# EasyEDA Pro project F1C200S-gateway.epro

# Schematic Schematic1_1
Assembly Variant: Basic; Board Name: Board1_1; Create Date: 2026-11-21; Page Name: P1; Project Name: 基于F1C200S的Linux无线调试与AI协作网关; Schematic Name: Schematic1_1; Update Date: 2026-11-21; Company: 嘉立创EDA; Page Size: A4; Version: V1.0
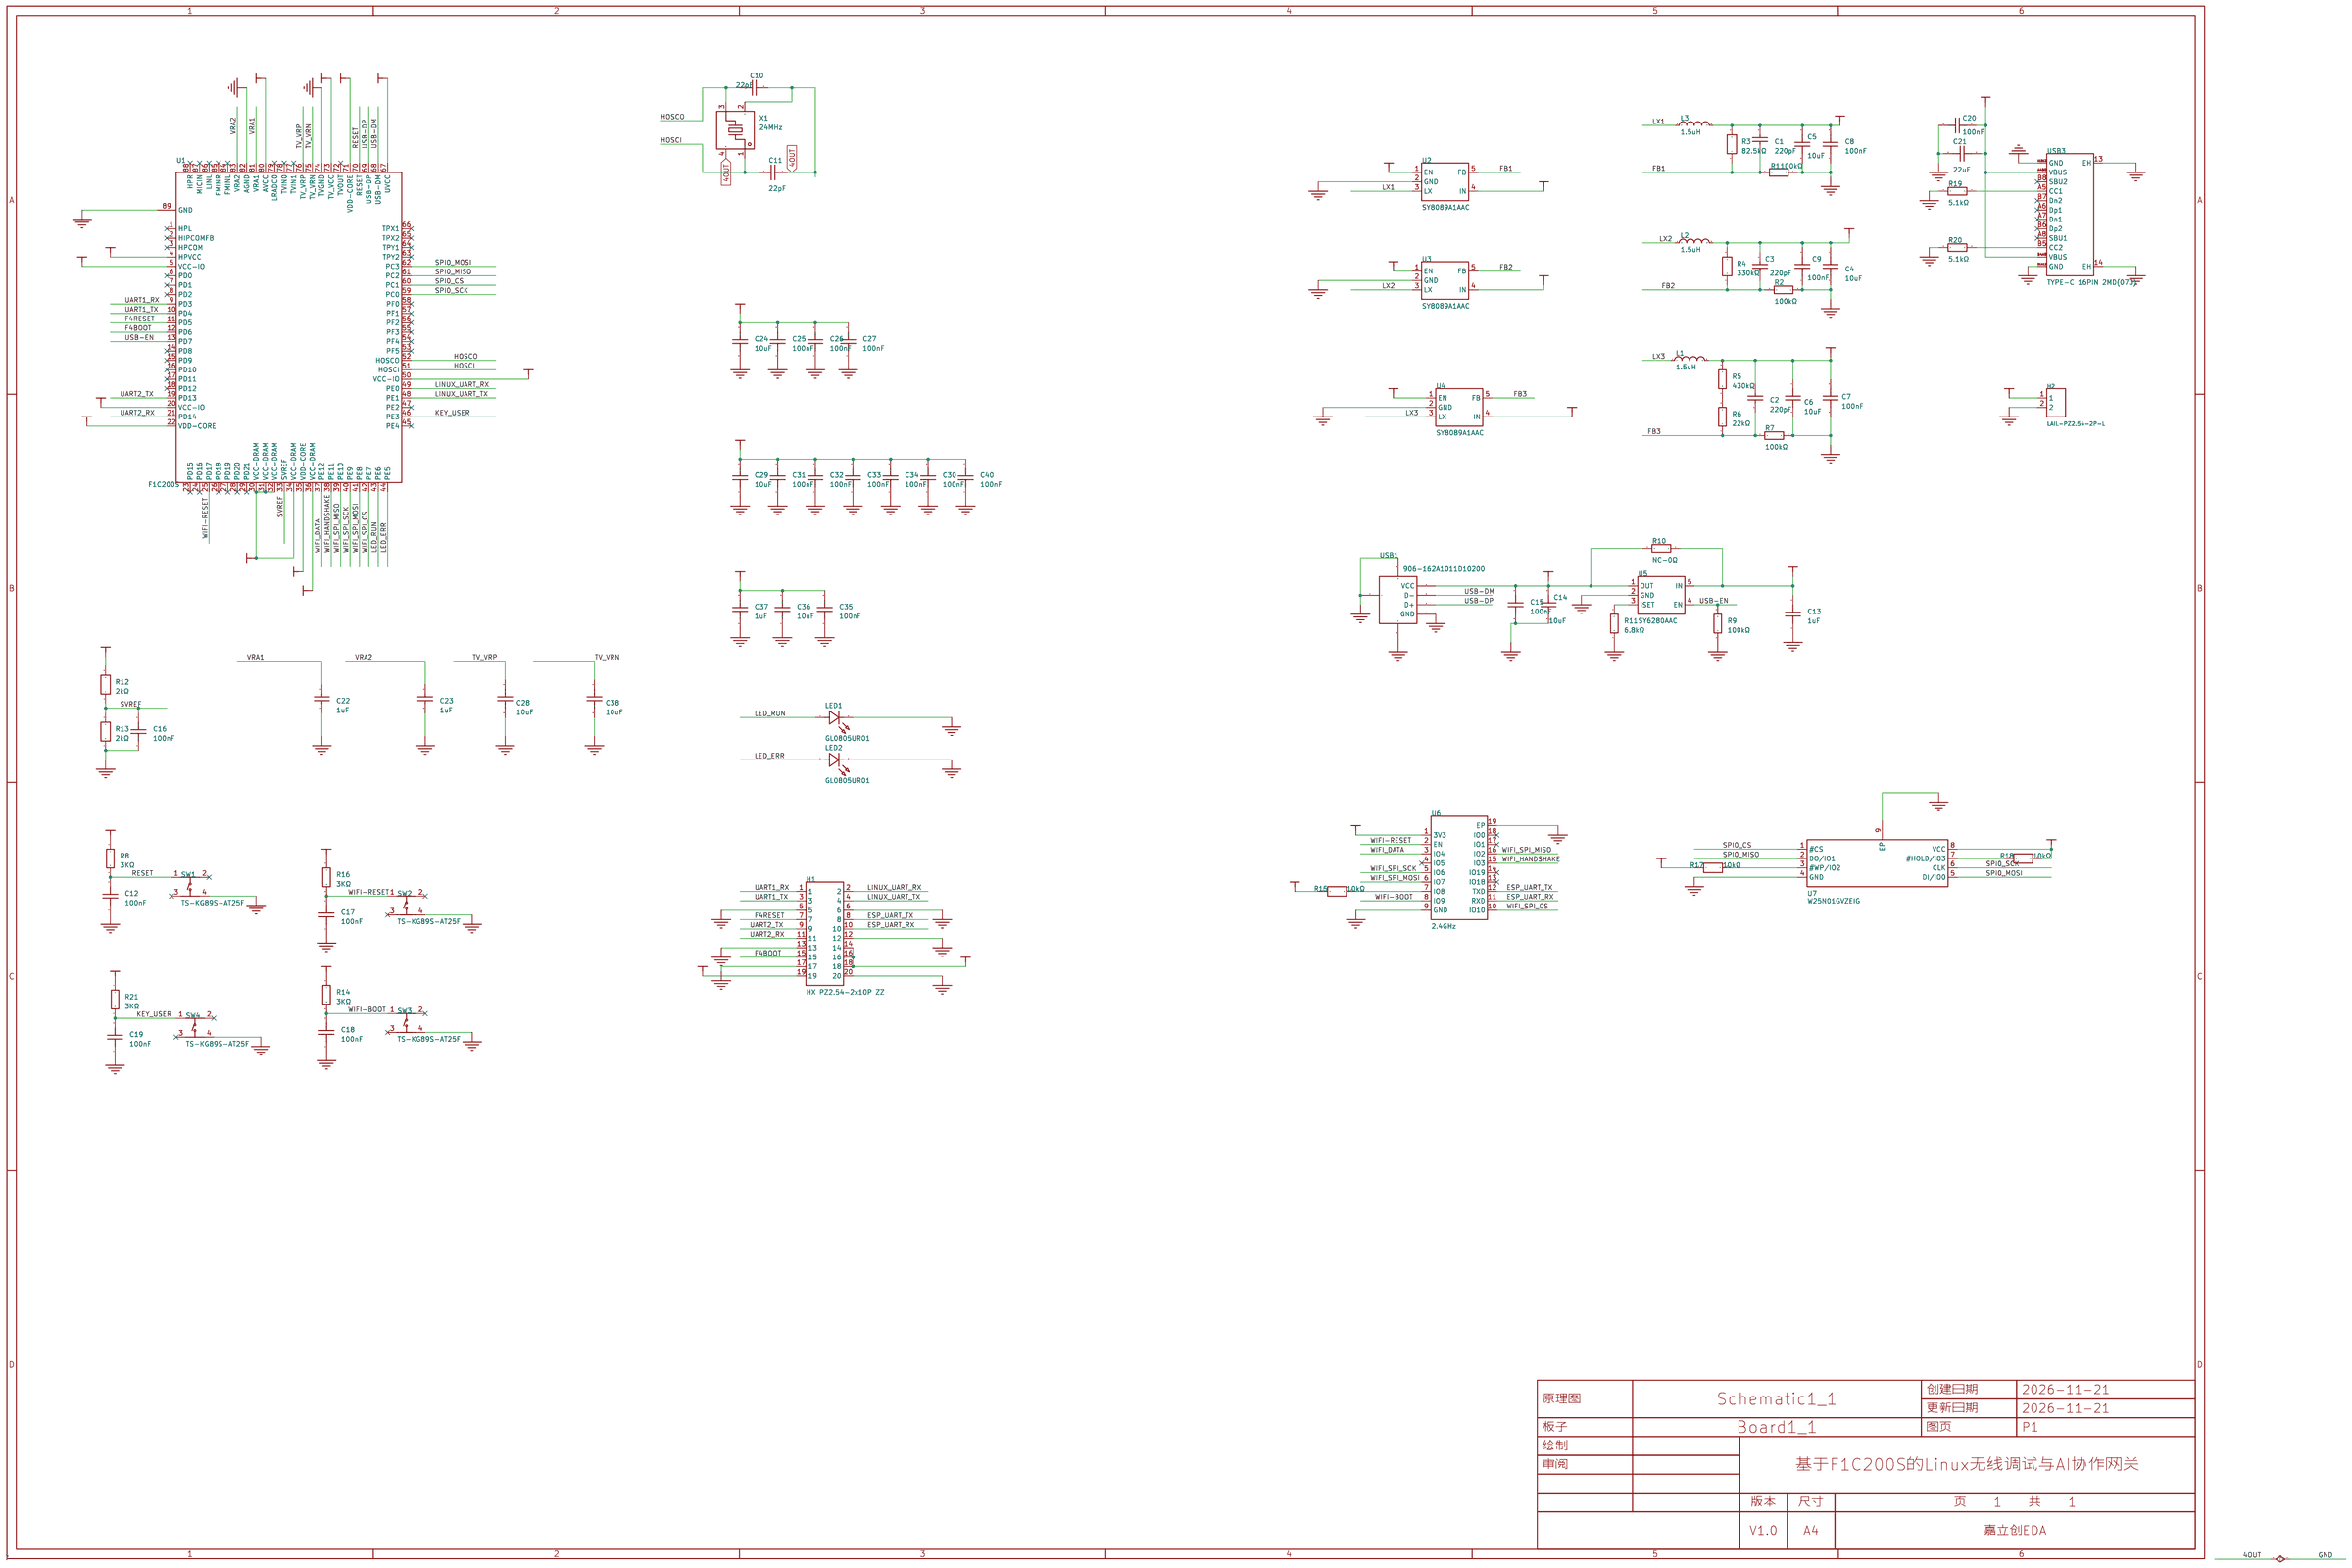
[diagram p0: schematic sheet]

## Parts
C1  220pF  [C0603]
C2  220pF  [C0603]
C3  220pF  [C0603]
C4  10uF  [C0603]
C5  10uF  [C0603]
C6  10uF  [C0603]
C7  100nF  [C0603]
C8  100nF  [C0603]
C9  100nF  [C0603]
C10  22pF  [C0603]
C11  22pF  [C0603]
C12  100nF  [C0603]
C13  1uF  [C0402]
C14  10uF  [C0603]
C15  100nF  [C0603]
C16  100nF  [C0603]
C17  100nF  [C0603]
C18  100nF  [C0603]
C19  100nF  [C0603]
C20  100nF  [C0603]
C21  22uF  [C0603]
C22  1uF  [C0603]
C23  1uF  [C0603]
C24  10uF  [C0603]
C25  100nF  [C0603]
C26  100nF  [C0603]
C27  100nF  [C0603]
C28  10uF  [C0603]
C29  10uF  [C0603]
C30  100nF  [C0603]
C31  100nF  [C0603]
C32  100nF  [C0603]
C33  100nF  [C0603]
C34  100nF  [C0603]
C35  100nF  [C0603]
C36  10uF  [C0603]
C37  1uF  [C0603]
C38  10uF  [C0603]
C40  100nF  [C0603]
H1  HX PZ2.54-2x10P ZZ  [HDR-TH_20P-P2.54-V-M-R2-C10-S2.54]
H2  LAIL-PZ2.54-2P-L  [CONN-TH_LAIL-PZ2.54-2P-L]
L1  1.5uH  [L0805]
L2  1.5uH  [L0805]
L3  1.5uH  [L0805]
LED1  GL0805UR01  [LED0805-R-RD_RED]
LED2  GL0805UR01  [LED0805-R-RD_RED]
R1  100kΩ  [R0805]
R2  100kΩ  [R0805]
R3  82.5kΩ  [R0805]
R4  330kΩ  [R0805]
R5  430kΩ  [R0805]
R6  22kΩ  [R0805]
R7  100kΩ  [R0805]
R8  3KΩ  [R0805]
R9  100kΩ  [R0805]
R10  NC-0Ω  [R0805]
R11  6.8kΩ  [R0805]
R12  2kΩ  [R0805]
R13  2kΩ  [R0805]
R14  3KΩ  [R0805]
R15  10kΩ  [R0805]
R16  3KΩ  [R0805]
R17  10kΩ  [R0805]
R18  10kΩ  [R0805]
R19  5.1kΩ  [R0805]
R20  5.1kΩ  [R0805]
R21  3KΩ  [R0805]
SW1  TS-KG89S-AT25F  [SW-SMD_4P-L4.2-W3.3-P2.15-LS5.1]
SW2  TS-KG89S-AT25F  [SW-SMD_4P-L4.2-W3.3-P2.15-LS5.1]
SW3  TS-KG89S-AT25F  [SW-SMD_4P-L4.2-W3.3-P2.15-LS5.1]
SW4  TS-KG89S-AT25F  [SW-SMD_4P-L4.2-W3.3-P2.15-LS5.1]
U1  F1C200S  [QFN-88_L10.0-W10.0-P0.40-BL-EP6.75]
U2  SY8089A1AAC  [TSOT-23-5_L2.9-W1.6-P0.95-LS2.8-BR]
U3  SY8089A1AAC  [TSOT-23-5_L2.9-W1.6-P0.95-LS2.8-BR]
U4  SY8089A1AAC  [TSOT-23-5_L2.9-W1.6-P0.95-LS2.8-BR]
U5  SY6280AAC  [SOT-23-5_L3.0-W1.7-P0.95-LS2.8-BL]
U6  2.4GHz  [BULETM-SMD_ESPRESSIF_ESP32-C3-WROOM-02-N4-4MB]
U7  W25N01GVZEIG  [WSON-8_L8.0-W6.10-P1.27-TL-EP]
USB1  906-162A1011D10200  [USB-A-TH_4P-P1.40-V-F-C39416]
USB3  TYPE-C 16PIN 2MD(073)  [USB-C-SMD_TYPE-C-16PIN-2MD-073]
X1  24MHz  [CRYSTAL-SMD_4P-L3.2-W2.5-BL]

## Library data of the parts
C1-C3 = CL10B221KB8NNNC: 容值:220pF;精度:±10%;额定电压:50V;温度系数:X7R;; LCSC Part Name: 220pF ±10% 50V; Supplier Part: C1603; Manufacturer: SAMSUNG(三星); Supplier Footprint: 0603; JLCPCB Part Class: Basic Part; Datasheet: https://item.szlcsc.com/datasheet/CL10B221KB8NNNC/1955.html; Supplier: LCSC; Tolerance: ±10%; Voltage Rating: 50V; Temperature Coefficient: X7R
C4-C6 C14 C24 C28 C29 C36 C38 = CL10A106KP8NNNC: 容值:10uF;精度:±10%;额定电压:10V;温度系数:X5R;; LCSC Part Name: 10uF ±10% 10V; Supplier Part: C19702; Manufacturer: SAMSUNG(三星); Supplier Footprint: 0603; JLCPCB Part Class: Basic Part; Datasheet: https://item.szlcsc.com/datasheet/CL10A106KP8NNNC/20411.html; Supplier: LCSC; Tolerance: ±10%; Voltage Rating: 10V; Temperature Coefficient: X5R
C7-C9 C15 C20 = CGA0603X7R104K500JT: 容值:100nF;精度:±10%;额定电压:50V;温度系数:X7R;; LCSC Part Name: 100nF ±10% 50V; Supplier Part: C6119867; Manufacturer: HRE(芯声); Supplier Footprint: 0603; JLCPCB Part Class: Extended Part; Datasheet: https://item.szlcsc.com/datasheet/CGA0603X7R104K500JT/7062573.html; Supplier: LCSC; Tolerance: ±10%; Voltage Rating: 50V; Temperature Coefficient: X7R
C10 C11 = CL10C220JB8NNNC: 容值:22pF;精度:±5%;额定电压:50V;温度系数:C0G;; LCSC Part Name: 22pF ±5% 50V; Supplier Part: C1653; Manufacturer: SAMSUNG(三星); Supplier Footprint: 0603; JLCPCB Part Class: Basic Part; Datasheet: https://item.szlcsc.com/datasheet/CL10C220JB8NNNC/2005.html; Supplier: LCSC; Tolerance: ±5%; Voltage Rating: 50V; Temperature Coefficient: C0G
C12 C17-C19 C25-C27 C30-C35 C40 = CC0603KRX7R9BB104: 容值:100nF;精度:±10%;额定电压:50V;温度系数:X7R;; LCSC Part Name: 100nF ±10% 50V; Supplier Part: C14663; Manufacturer: YAGEO(国巨); Supplier Footprint: 0603; JLCPCB Part Class: Basic Part; Datasheet: https://item.szlcsc.com/datasheet/CC0603KRX7R9BB104/15331.html; Supplier: LCSC; Tolerance: ±10%; Voltage Rating: 50V; Temperature Coefficient: X7R
C13 = HGC0402R5105K500NTEJ: 容值:1uF;精度:±10%;额定电压:50V;温度系数:X5R;; LCSC Part Name: 1uF ±10% 50V; Supplier Part: C7472948; Manufacturer: Chinocera(华瓷); Supplier Footprint: 0402; JLCPCB Part Class: Extended Part; Datasheet: https://item.szlcsc.com/datasheet/HGC0402R5105K500NTEJ/8532795.html; Supplier: LCSC; Tolerance: ±10%; Voltage Rating: 50V; Temperature Coefficient: X5R
C16 = FCC0603B104K500CT: 容值:100nF;精度:±10%;额定电压:50V;温度系数:X7R;; LCSC Part Name: 100nF ±10% 50V; Supplier Part: C5137636; Manufacturer: FOJAN(富捷); Supplier Footprint: 0603; JLCPCB Part Class: Extended Part; Datasheet: https://item.szlcsc.com/datasheet/FCC0603B104K500CT/5747088.html; Supplier: LCSC; Tolerance: ±10%; Voltage Rating: 50V; Temperature Coefficient: X7R; Operating Temperature: -55℃~+125℃
C21 = HGC0603R5226M100NTHJ: 容值:22uF;精度:±20%;额定电压:10V;温度系数:X5R;; LCSC Part Name: 22uF ±20% 10V; Supplier Part: C7432770; Manufacturer: Chinocera(华瓷); Supplier Footprint: 0603; JLCPCB Part Class: Extended Part; Datasheet: https://item.szlcsc.com/datasheet/HGC0603R5226M100NTHJ/8438252.html; Supplier: LCSC; Tolerance: ±20%; Voltage Rating: 10V; Temperature Coefficient: X5R
C22 C23 = CL10A105KO8NNNC: 容值:1uF;精度:±10%;额定电压:16V;温度系数:X5R;; LCSC Part Name: 1uF ±10% 16V; Supplier Part: C1592; Manufacturer: SAMSUNG(三星); Supplier Footprint: 0603; JLCPCB Part Class: Extended Part; Datasheet: https://item.szlcsc.com/datasheet/CL10A105KO8NNNC/1944.html; Supplier: LCSC; Tolerance: ±10%; Voltage Rating: 16V; Temperature Coefficient: X5R
C37 = CL10A105KB8NNNC: 容值:1uF;精度:±10%;额定电压:50V;温度系数:X5R;; LCSC Part Name: 1uF ±10% 50V; Supplier Part: C15849; Manufacturer: SAMSUNG(三星); Supplier Footprint: 0603; JLCPCB Part Class: Basic Part; Datasheet: https://item.szlcsc.com/datasheet/CL10A105KB8NNNC/16531.html; Supplier: LCSC; Tolerance: ±10%; Voltage Rating: 50V; Temperature Coefficient: X5R
H1 = HX PZ2.54-2x10P ZZ: 插针结构:2x10P;间距:2.54mm;行距:2.54mm;圆针/方针:方针;安装方式:直插;排数:双排;总PIN位数:20P;额定电流:3A;额定电压:1kV;配合针长度:6mm;塑高:2.5mm;端接针长度:3mm;触头材质:铜合金;触头镀层:金;工作温度:-40℃~+105℃;颜色:黑色;; LCSC Part Name: 2x10P 间距:2.54mm 方针 直插; Supplier Part: C42372518; Manufacturer: hanxia(韩下); Supplier Footprint: 插件,P=2.54mm; JLCPCB Part Class: Extended Part; Datasheet: https://item.szlcsc.com/datasheet/HX%2520PZ2.54-2x10P%2520ZZ/44255759.html; Supplier: LCSC; Pin Structure: 2x10P; Pitch: 2.54mm; Row Spacing: 2.54mm; Circluar Pins/Square Pins: 方针; Mounting Type: 直插; Number of Rows: 双排; Number of Pins: 20P; Current Rating: 3A; Voltage Rating (Max): 1kV; Length of Mating Pin: 6mm; Insulation Height: 2.5mm; Length of End Connection Pin: 3mm; Contact Material: 铜合金; Contact Plating: 金; Operating Temperature: -40℃~+105℃; Color: 黑色
H2 = LAIL-PZ2.54-2P-L: 插针结构:1x2P;间距:2.54mm;圆针/方针:方针;安装方式:直插;排数:单排;总PIN位数:2P;额定电流:3A;额定电压:250V;配合针长度:6mm;塑高:2.5mm;端接针长度:3mm;触头材质:黄铜;触头镀层:金;工作温度:-25℃~+80℃;颜色:黑色;; LCSC Part Name: 1x2P 间距:2.54mm 方针 直插; Supplier Part: C54950603; Manufacturer: LAILAN(莱联); Supplier Footprint: 插件,P=2.54mm; JLCPCB Part Class: Extended Part; Datasheet: https://item.szlcsc.com/datasheet/LAIL-PZ2.54-2P-L/58519956.html; Supplier: LCSC; Pin Structure: 1x2P; Pitch: 2.54mm; Circluar Pins/Square Pins: 方针; Mounting Type: 直插; Number of Rows: 单排; Number of Pins: 2P; Current Rating: 3A; Voltage Rating (Max): 250V; Length of Mating Pin: 6mm; Insulation Height: 2.5mm; Length of End Connection Pin: 3mm; Contact Material: 黄铜; Contact Plating: 金; Operating Temperature: -25℃~+80℃; Color: 黑色
L1-L3 = DFE201210U-1R5M=P2: 电感值:1.5uH;精度:±20%;额定电流:1.6A;饱和电流(Isat):2.5A;; LCSC Part Name: 1.5uH ±20% 2.5A; Supplier Part: C2891571; Manufacturer: muRata(村田); Supplier Footprint: 0805; JLCPCB Part Class: Extended Part; Datasheet: https://item.szlcsc.com/datasheet/DFE201210U-1R5M%253DP2/3118954.html; Supplier: LCSC; Tolerance: ±20%; Current Rating: 1.6A; Current - Saturation(Isat): 2.5A; DC Resistance(DCR): 138mΩ
LED1 LED2 = GL0805UR01: 灯头类型:2mmx1.25mm方形灯头;发光颜色:红色;正向压降(Vf):1.8V~2.1V;功率:-;测试电流:20mA;波长:620nm~625nm;二极管配置:独立二极管;透镜颜色:无色透明透镜;色温:-;发光强度:80mcd~100mcd;发光角度:120°;载带方式:正贴;工作温度:-40℃~+85℃;; LCSC Part Name: 0805 红灯 高亮; Supplier Part: C51933307; Manufacturer: Guiguang light(桂光光电); Supplier Footprint: 0805; JLCPCB Part Class: Extended Part; Datasheet: https://item.szlcsc.com/datasheet/GL0805UR01/54646003.html; Supplier: LCSC; Lamp Holder Type: 2mmx1.25mm方形灯头; Illumination Color: 红色; Voltage - Forward(Vf): 1.8V~2.1V; Test Current: 20mA; Wavelength - Dominant: 620nm~625nm; Diode Configuration: 独立二极管; Lens Color: 无色透明透镜; Luminous Intensity: 80mcd~100mcd; Viewing Angle: 120°; Mounting Style: 正贴; Operating Temperature: -40℃~+85℃
R1 R2 R7 R9 R10 = 0805W8F1003T5E: 电阻类型:厚膜电阻;阻值:100kΩ;精度:±1%;功率:125mW;工作电压:150V;温度系数:±100ppm/℃;; LCSC Part Name: 100kΩ ±1% 125mW 厚膜电阻; Supplier Part: C149504; Manufacturer: UNI-ROYAL(厚声); Supplier Footprint: 0805; JLCPCB Part Class: Basic Part; Datasheet: https://item.szlcsc.com/datasheet/0805W8F1003T5E/160838.html; Supplier: LCSC; Type: 厚膜电阻; Tolerance: ±1%; Power(Watts): 125mW; Voltage-Supply(Max): 150V; Temperature Coefficient: ±100ppm/℃; Operating Temperature: -55℃~+155℃
R3 = FRC0805F8252TS: 电阻类型:厚膜电阻;阻值:82.5kΩ;精度:±1%;功率:125mW;工作电压:150V;温度系数:±100ppm/℃;; LCSC Part Name: 82.5kΩ ±1% 125mW 厚膜电阻; Supplier Part: C3013228; Manufacturer: FOJAN(富捷); Supplier Footprint: 0805; JLCPCB Part Class: Extended Part; Supplier: LCSC; Type: 厚膜电阻; Tolerance: ±1%; Power(Watts): 125mW; Voltage-Supply(Max): 150V; Temperature Coefficient: ±100ppm/℃; Operating Temperature: -55℃~+155℃
R4 = FRC0805F3303TS: 电阻类型:厚膜电阻;阻值:330kΩ;精度:±1%;功率:125mW;工作电压:150V;温度系数:±100ppm/℃;; LCSC Part Name: 330kΩ ±1% 125mW 厚膜电阻; Supplier Part: C2907257; Manufacturer: FOJAN(富捷); Supplier Footprint: 0805; JLCPCB Part Class: Extended Part; Datasheet: https://item.szlcsc.com/datasheet/FRC0805F3303TS/3180770.html; Supplier: LCSC; Type: 厚膜电阻; Tolerance: ±1%; Power(Watts): 125mW; Voltage-Supply(Max): 150V; Temperature Coefficient: ±100ppm/℃; Operating Temperature: -55℃~+155℃
R5 = PTFR0805B430KN9: 电阻类型:薄膜电阻;阻值:430kΩ;精度:±0.1%;功率:130mW;工作电压:150V;温度系数:±10ppm/℃;; LCSC Part Name: 薄膜电阻 430kΩ ±0.1% 130mW; Supplier Part: C351566; Manufacturer: RESI(开步睿思); Supplier Footprint: 0805; JLCPCB Part Class: Extended Part; Datasheet: https://item.szlcsc.com/datasheet/PTFR0805B430KN9/327474.html; Supplier: LCSC; Type: 薄膜电阻; Tolerance: ±0.1%; Power(Watts): 130mW; Voltage-Supply(Max): 150V; Temperature Coefficient: ±10ppm/℃; Operating Temperature: -55℃~+125℃
R6 = 0805W8F2202T5E: 电阻类型:厚膜电阻;阻值:22kΩ;精度:±1%;功率:125mW;工作电压:150V;温度系数:±100ppm/℃;; LCSC Part Name: 22kΩ ±1% 125mW 厚膜电阻; Supplier Part: C17560; Manufacturer: UNI-ROYAL(厚声); Supplier Footprint: 0805; JLCPCB Part Class: Basic Part; Datasheet: https://item.szlcsc.com/datasheet/0805W8F2202T5E/18248.html; Supplier: LCSC; Type: 厚膜电阻; Tolerance: ±1%; Power(Watts): 125mW; Voltage-Supply(Max): 150V; Temperature Coefficient: ±100ppm/℃; Operating Temperature: -55℃~+155℃
R8 R14 R16 R21 = 0805W8F1002T5E_C17414: 电阻类型:厚膜电阻;阻值:10kΩ;精度:±1%;功率:125mW;工作电压:150V;温度系数:±100ppm/℃;; LCSC Part Name: 10kΩ ±1% 125mW 厚膜电阻; Supplier Part: C17414; Manufacturer: UNI-ROYAL(厚声); Manufacturer Part: 0805W8F1002T5E; Supplier Footprint: 0805; JLCPCB Part Class: Basic Part; Datasheet: https://item.szlcsc.com/datasheet/0805W8F1002T5E/18102.html; Supplier: LCSC; Type: 厚膜电阻; Tolerance: ±1%; Power(Watts): 125mW; Voltage-Supply(Max): 150V; Temperature Coefficient: ±100ppm/℃; Operating Temperature: -55℃~+155℃
R11 = 0805W8F6801T5E: 电阻类型:厚膜电阻;阻值:6.8kΩ;精度:±1%;功率:125mW;工作电压:150V;温度系数:±100ppm/℃;; LCSC Part Name: 6.8kΩ ±1% 125mW 厚膜电阻; Supplier Part: C17772; Manufacturer: UNI-ROYAL(厚声); Supplier Footprint: 0805; JLCPCB Part Class: Basic Part; Datasheet: https://item.szlcsc.com/datasheet/0805W8F6801T5E/18460.html; Supplier: LCSC; Type: 厚膜电阻; Tolerance: ±1%; Power(Watts): 125mW; Voltage-Supply(Max): 150V; Temperature Coefficient: ±100ppm/℃; Operating Temperature: -55℃~+155℃
R12 R13 = FRC0805F2001TS: 电阻类型:厚膜电阻;阻值:2kΩ;精度:±1%;功率:125mW;工作电压:150V;温度系数:±100ppm/℃;; LCSC Part Name: 2kΩ ±1% 125mW 厚膜电阻; Supplier Part: C2907248; Manufacturer: FOJAN(富捷); Supplier Footprint: 0805; JLCPCB Part Class: Extended Part; Supplier: LCSC; Type: 厚膜电阻; Tolerance: ±1%; Power(Watts): 125mW; Voltage-Supply(Max): 150V; Temperature Coefficient: ±100ppm/℃; Operating Temperature: -55℃~+155℃
R15 R17 R18 = FRC0805F1002TS: 电阻类型:厚膜电阻;阻值:10kΩ;精度:±1%;功率:125mW;工作电压:150V;温度系数:±100ppm/℃;; LCSC Part Name: 10kΩ ±1% 125mW 厚膜电阻; Supplier Part: C2907219; Manufacturer: FOJAN(富捷); Supplier Footprint: 0805; JLCPCB Part Class: Extended Part; Supplier: LCSC; Type: 厚膜电阻; Tolerance: ±1%; Power(Watts): 125mW; Voltage-Supply(Max): 150V; Temperature Coefficient: ±100ppm/℃; Operating Temperature: -55℃~+155℃
R19 R20 = 0805W8F5101T5E: 电阻类型:厚膜电阻;阻值:5.1kΩ;精度:±1%;功率:125mW;工作电压:150V;温度系数:±100ppm/℃;; LCSC Part Name: 5.1kΩ ±1% 125mW 厚膜电阻; Supplier Part: C27834; Manufacturer: UNI-ROYAL(厚声); Supplier Footprint: 0805; JLCPCB Part Class: Basic Part; Datasheet: https://item.szlcsc.com/datasheet/0805W8F5101T5E/28584.html; Supplier: LCSC; Type: 厚膜电阻; Tolerance: ±1%; Power(Watts): 125mW; Voltage-Supply(Max): 150V; Temperature Coefficient: ±100ppm/℃; Operating Temperature: -55℃~+155℃
SW1-SW4 = TS-KG89S-AT25F: 电路结构:单刀单掷;按钮形状:椭圆形按钮;作用力:250gf;安装方式:立贴;开关长度:4.2mm;开关宽度:3.25mm;开关高度:2.5mm;带支架:不带;触点电流:50mA;额定电压(DC):12V;绝缘电阻:100MΩ;机械寿命:10万次;; LCSC Part Name: 4.2*3.25*2.5mm 立贴 轻触开关; Supplier Part: C2874599; Manufacturer: HANBO(汉博); Supplier Footprint: SMD; JLCPCB Part Class: Extended Part; Datasheet: https://atta.szlcsc.com/upload/public/pdf/source/20221110/0D75E68DCC1CEC2670E8A2B9A9134A65.pdf; Supplier: LCSC; Circuit: 单刀单掷; Actuator Style: 椭圆形按钮; Operating Force: 250gf; Mounting Style: 立贴; Switch Length: 4.2mm; Switch Width: 3.25mm; Switch Height: 2.5mm; Strike Gundam: 不带; Contact Current: 50mA; Voltage Rating (DC): 12V; Insulation Resistance: 100MΩ; Actuator/Cap Color: 白色; Pin Style: SMD接片; Mechanical Life: 10万次
U1 = F1C200S: CPU内核:其他;CPU位数:32 Bit;; LCSC Part Name: Allwinner F1C200S; Supplier Part: C2879851; Manufacturer: Allwinner(全志); Supplier Footprint: QFN-88-EP(10x10); JLCPCB Part Class: Extended Part; Datasheet: https://item.szlcsc.com/datasheet/F1C200S/3089073.html; Supplier: LCSC; CPU Core: 其他; Core Size: 32 Bit; Program Memory Type: 外接; ADC (Bit): 6bit；12bit; Oscillator Type: 外置; Operating Temperature: -20℃~+85℃
U2-U4 = SY8089A1AAC: 功能类型:降压型;工作电压:2.5V~5.5V;输出电压:-;输出电流:2A;输出类型:可调;; LCSC Part Name: 高效1.5MHz 2A同步降压调节器; Supplier Part: C479074; Manufacturer: Silergy(矽力杰); Supplier Footprint: SOT-23-5; JLCPCB Part Class: Extended Part; Datasheet: https://item.szlcsc.com/datasheet/SY8089A1AAC/486366.html; Supplier: LCSC; Function: 降压型; Voltage - Supply: 2.5V~5.5V; Output Current: 2A; Frequency - Switching: 1.5MHz; Operating Temperature: -40℃~+125℃@(TA/TJ); Synchronous Rectifier: 是; Number of Outputs: 1; Topology: 降压式; Quiescent Current: 50uA; Switch tube (built-in/external): 内置; Output Type: 可调
U5 = SY6280AAC_C55136: 类型:高侧开关;通道数:1;输入控制逻辑:高电平有效;工作电压:2.4V~5.5V;最大连续电流:2A;导通电阻:80mΩ;; LCSC Part Name: 低损耗功率分配开关; Supplier Part: C55136; Manufacturer: Silergy(矽力杰); Supplier Footprint: SOT-23-5; JLCPCB Part Class: Extended Part; Datasheet: https://item.szlcsc.com/datasheet/SY6280AAC/56162.html; Supplier: LCSC; Type: 高侧开关; Number of Channels: 1; Control Input Logic: 高电平有效; Voltage - Supply: 2.4V~5.5V; Maximum Continuous Current: 2A; RDS(on): 80mΩ; Features: 短路保护；过流保护；反向电流阻断；输出放电功能；过温保护; Operating Temperature	-: -40℃~+125℃
U6 = ESP32-C3-WROOM-02-N4: 核心芯片:ESP32-C3芯片;频率:2.4GHz;天线形式:板载PCB天线;发射功率:20.5dBm;接收灵敏度:-105dBm;; LCSC Part Name: 不带固件 2.4GHz Wi-Fi（802.11b/g/n）+ 蓝牙5模组; Supplier Part: C2934560; Manufacturer: ESPRESSIF(乐鑫); Supplier Footprint: SMD,20x18mm; JLCPCB Part Class: Extended Part; Datasheet: https://item.szlcsc.com/datasheet/ESP32-C3-WROOM-02-N4/3281215.html; Supplier: LCSC; Utilized IC / Part: ESP32-C3芯片; Wireless Standard: Bluetooth5.0; Interface Type: I2S；I2C；JTAG；UART；USB；SPI; Antenna Type: 板载PCB天线; Output Power: 20.5dBm; Voltage - Supply: 3V~3.6V; Receive  Current: 82mA; Send  Current: 345mA; Sensitivity: -105dBm; Operating Temperature: -40℃~+85℃; Features: 集成蓝牙功能；支持USB接口
U7 = W25N01GVZEIG_C88868: 存储容量:1Gbit;时钟频率(fc):104MHz;工作电压:2.7V~3.6V;; LCSC Part Name: 具备双/四路SPI缓冲读取和连续读取功能的3V、1Gb串行SLCNAND闪存; Supplier Part: C88868; Manufacturer: Winbond(华邦); Supplier Footprint: WSON-8-EP(6x8); JLCPCB Part Class: Extended Part; Datasheet: https://item.szlcsc.com/datasheet/W25N01GVZEIG/90048.html; Supplier: LCSC; Memory Size: 1Gbit; Interface: SPI; Clock Frequency: 104MHz; Voltage - Supply: 2.7V~3.6V; Page Program time (TPP): 700us; Block Erase Time(tBE): 2ms; Data Retention - TDR (Year): 10年; Operating Temperature: -40℃~+85℃; Standby Supply Current: 10uA; Program / Erase Cycles: 10万次; Features: 坏块管理功能；硬件写保护功能；读缓存功能；OTP区域写保护与锁定功能；ECC纠错功能；软件复位功能；写使能锁存；软件写保护功能; ECC: 有
USB1 = 906-162A1011D10200: 连接器类型:Type-A;协议标准:USB 2.0;公母:母;安装方式:侧插;触点数量:4P;端口数量:1;额定电流 - 电源:2A;工作温度:-;; LCSC Part Name: Type-A 母 侧插; Supplier Part: C39417; Manufacturer: 精拓金; Supplier Footprint: 插件; JLCPCB Part Class: Extended Part; Datasheet: https://item.szlcsc.com/datasheet/906-162A1011D10200/40400.html; Supplier: LCSC; Connector Type: Type-A; Protocol Standard: USB 2.0; Gender: 母; Mounting Type: 侧插; Number of Contacts: 4P; Number of Ports: 1; Current Rating-Power: 2A; Voltage Rating: 30V; Connect-Disconnect Life: 1.5千次; Length: 14mm
USB3 = TYPE-C 16PIN 2MD(073): 连接器类型:Type-C;协议标准:-;公母:母;安装方式:卧贴;触点数量:16P;端口数量:1;额定电流 - 电源:3A;工作温度:-25℃~+85℃;; LCSC Part Name: Type-C 母 卧贴; Supplier Part: C2765186; Manufacturer: SHOU HAN(首韩); Supplier Footprint: SMD; JLCPCB Part Class: Extended Part; Datasheet: https://item.szlcsc.com/datasheet/TYPE-C%252016PIN%25202MD(073)/2901843.html; Supplier: LCSC; Connector Type: Type-C; Gender: 母; Mounting Type: 卧贴; Number of Contacts: 16P; Number of Ports: 1; Current Rating-Power: 3A; Voltage Rating: 5V; Connect-Disconnect Life: 1万次; Detection color: 黑色; Operating Temperature: -25℃~+85℃
X1 = XL2EL89COI-111YLC-24M: 晶振类型:贴片晶振;频率:24MHz;常温频差:±10ppm;负载电容:12pF;频率稳定度:±20ppm;; LCSC Part Name: YSX321SL 24MHZ 4P 3225 12PF ±10PPM -40~85℃ (±20PPM); Supplier Part: C5444545; Manufacturer: YXC(扬兴晶振); Supplier Footprint: SMD3225-4P; JLCPCB Part Class: Extended Part; Datasheet: https://item.szlcsc.com/datasheet/XL2EL89COI-111YLC-24M/6336541.html; Supplier: LCSC; Type: 贴片晶振; Normal temperature Frequency Tolerance: ±10ppm; Load Capacitance: 12pF; Frequency Stability: ±20ppm; Operating Temperature: -40℃~+85℃

## Nets
1.1V: C1.2 C5.1 C8.2 C24.2 C25.2 C26.2 C27.2 L3.2 R3.2 U1.22(VDD-CORE) U1.35(VDD-CORE) U1.71(VDD-CORE)
2V5: C3.2 C4.1 C9.2 C35.2 C36.2 C37.2 L2.2 R4.2 R12.2 U1.30(VCC-DRAM) U1.31(VCC-DRAM) U1.32(VCC-DRAM) U1.34(VCC-DRAM) U1.36(VCC-DRAM) U1.80(AVCC)
3V3: C2.2 C6.1 C7.2 C29.2 C30.2 C31.2 C32.2 C33.2 C34.2 C40.2 H1.14 H1.16 H1.18 L1.2 R5.2 R8.1 R14.1 R15.1 R16.1 R17.1 R18.2 R21.1 U1.4(HPVCC) U1.5(VCC-IO) U1.20(VCC-IO) U1.50(VCC-IO) U1.67(UVCC) U1.73(TV_VCC) U6.1(3V3) U7.8(VCC)
+5V: C13.2 C20.1 C21.1 H1.19 H2.1 R10.1 U2.1(EN) U2.4(IN) U3.1(EN) U3.4(IN) U4.1(EN) U4.4(IN) U5.5(IN) USB3.A4B9(VBUS) USB3.B4A9(VBUS)
GND: C4.2 C5.2 C6.2 C7.1 C8.1 C9.1 C10.2 C11.2 C12.1 C13.1 C14.2 C15.2 C16.1 C17.1 C18.1 C19.1 C20.2 C21.2 C22.1 C23.1 C24.1 C25.1 C26.1 C27.1 C28.2 C29.1 C30.1 C31.1 C32.1 C33.1 C34.1 C35.1 C36.1 C37.1 C38.2 C40.1 H1.5 H1.6 H1.12 H1.13 H1.17 H1.20 H2.2 LED1.2(C) LED2.2(C) R1.1 R2.2 R7.2 R9.1 R11.1 R13.1 R19.1 R20.1 SW1.4 SW2.4 SW3.4 SW4.4 U1.74(TVGND) U1.82(AGND) U1.89(GND) U2.2(GND) U3.2(GND) U4.2(GND) U5.2(GND) U6.9(GND) U6.19(EP) U7.4(GND) U7.9(EP) USB1.4(GND) USB1.5 USB1.6 USB1.7 USB3.13(EH) USB3.14(EH) USB3.A1B12(GND) USB3.B1A12(GND) X1.2(GND) X1.4(GND)
ESP_UART_RX: H1.10 U6.11(RXD)
ESP_UART_TX: H1.8 U6.12(TXD)
F4BOOT: H1.15 U1.12(PD6)
F4RESET: H1.7 U1.11(PD5)
FB1: C1.1 R1.2 R3.1 U2.5(FB)
FB2: C3.1 R2.1 R4.1 U3.5(FB)
FB3: C2.1 R6.1 R7.1 U4.5(FB)
HOSCI: C11.1 U1.51(HOSCI) X1.1
HOSCO: C10.1 U1.52(HOSCO) X1.3
KEY_USER: C19.2 R21.2 SW4.1 U1.46(PE3)
LED_ERR: LED2.1(A) U1.44(PE5)
LED_RUN: LED1.1(A) U1.43(PE6)
LINUX_UART_RX: H1.2 U1.49(PE0)
LINUX_UART_TX: H1.4 U1.48(PE1)
LX1: L3.1 U2.3(LX)
LX2: L2.1 U3.3(LX)
LX3: L1.1 U4.3(LX)
RESET: C12.2 R8.2 SW1.1 U1.70(RESET)
SPI0_CS: U1.60(PC1) U7.1(#CS)
SPI0_MISO: U1.61(PC2) U7.2(DO/IO1)
SPI0_MOSI: U1.62(PC3) U7.5(DI/IO0)
SPI0_SCK: U1.59(PC0) U7.6(CLK)
SVREF: C16.2 R12.1 R13.2 U1.33(SVREF)
TV_VRN: C38.1 U1.75(TV_VRN)
TV_VRP: C28.1 U1.76(TV_VRP)
UART1_RX: H1.1 U1.9(PD3)
UART1_TX: H1.3 U1.10(PD4)
UART2_RX: H1.11 U1.21(PD14)
UART2_TX: H1.9 U1.19(PD13)
USB-5V: C14.1 C15.1 R10.2 U5.1(OUT) USB1.1(VCC)
USB-DM: U1.68(USB-DM) USB1.2(D-)
USB-DP: U1.69(USB-DP) USB1.3(D+)
USB-EN: R9.2 U1.13(PD7) U5.4(EN)
VRA1: C22.2 U1.81(VRA1)
VRA2: C23.2 U1.83(VRA2)
WIFI-BOOT: C18.2 R14.2 SW3.1 U6.8(IO9)
WIFI-RESET: C17.2 R16.2 SW2.1 U1.25(PD17) U6.2(EN)
WIFI_DATA: U1.37(PE12) U6.3(IO4)
WIFI_HANDSHAKE: U1.38(PE11) U6.15(IO3)
WIFI_SPI_CS: U1.42(PE7) U6.10(IO10)
WIFI_SPI_MISO: U1.39(PE10) U6.16(IO2)
WIFI_SPI_MOSI: U1.41(PE8) U6.6(IO7)
WIFI_SPI_SCK: U1.40(PE9) U6.5(IO6)
$1N25: R5.1 R6.2
$1N102: R11.2 U5.3(ISET)
$1N125: R15.2 U6.7(IO8)
$1N137: R17.2 U7.3(#WP/IO2)
$1N141: R18.1 U7.7(#HOLD/IO3)
$1N180: R20.2 USB3.B5(CC2)
$1N181: R19.2 USB3.A5(CC1)

Not connected (* = marked no-connect by the designer): SW1 2* 3*; SW2 2* 3*; SW3 2* 3*; SW4 2* 3*; U1 1(HPL)* 2(HIPCOMFB)* 3(HPCOM)* 6(PD0)* 7(PD1)* 8(PD2)* 14(PD8)* 15(PD9)* 16(PD10)* 17(PD11)* 18(PD12)* 23(PD15)* 24(PD16)* 26(PD18)* 27(PD19)* 28(PD20)* 29(PD21)* 45(PE4)* 47(PE2)* 53(PF5)* 54(PF4)* 55(PF3)* 56(PF2)* 57(PF1)* 58(PF0)* 63(TPY2)* 64(TPY1)* 65(TPX2)* 66(TPX1)* 72(TVOUT)* 77(TVIN1)* 78(TVIN0)* 79(LRADC0)* 84(FMINL)* 85(FMINR)* 86(LINL)* 87(MICIN)* 88(HPR)*; U6 4(IO5)* 13(IO18)* 14(IO19)* 17(IO1)* 18(IO0)*; USB3 A6(Dp1)* A7(Dn1)* A8(SBU1)* B6(Dp2)* B7(Dn2)* B8(SBU2)*

# Board PCB1_1
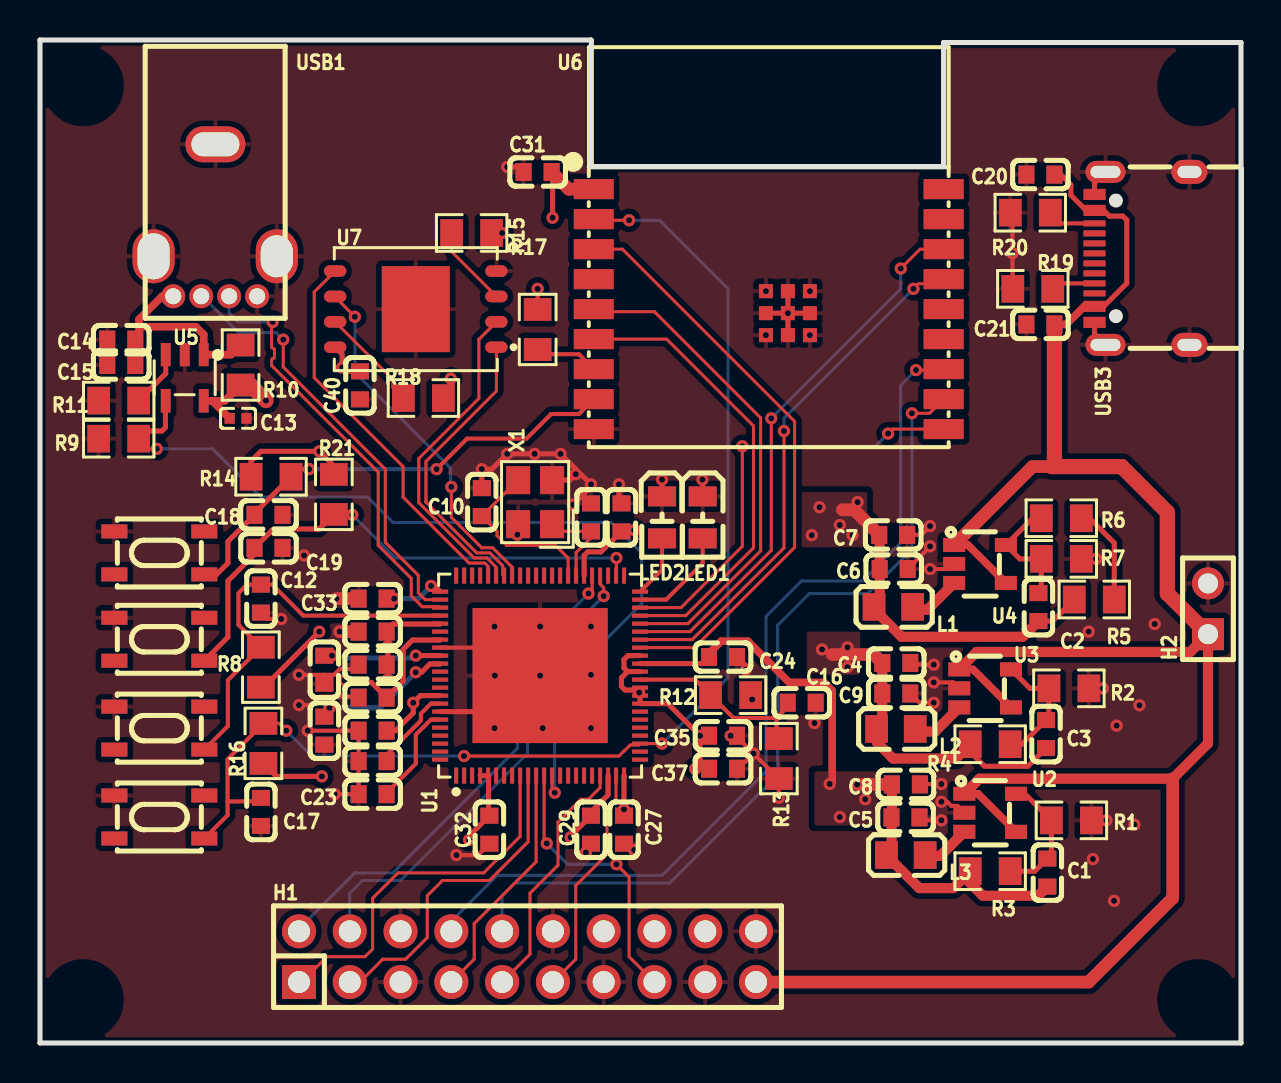
[diagram p1: board, top side]
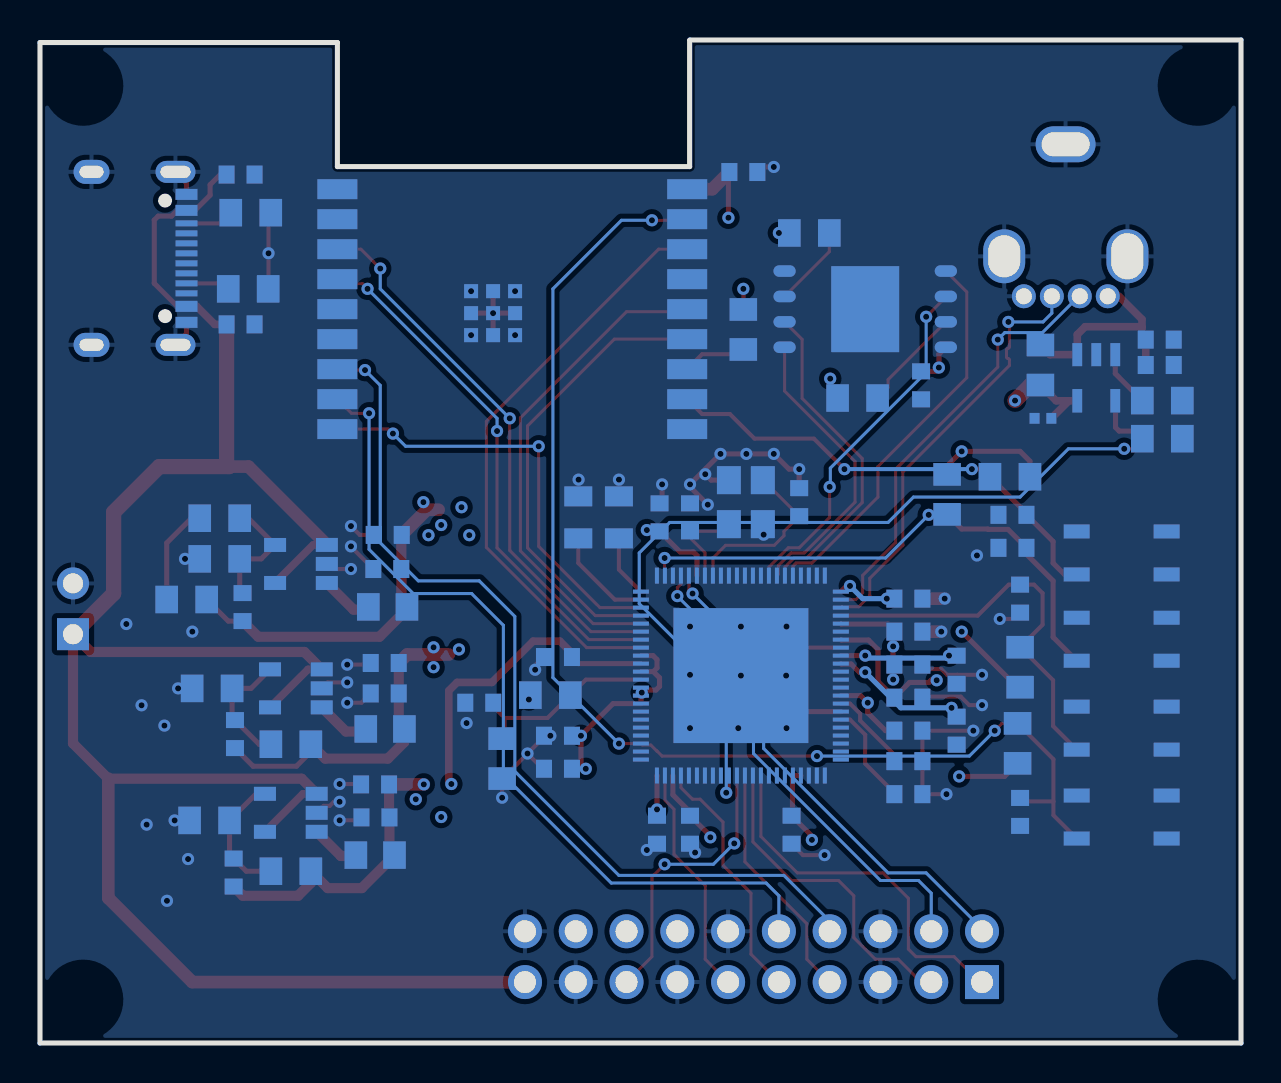
[diagram p2: board, bottom side, seen from below]

Outline 60.07 x 50.17 mm; copper layers: Top Layer, Inner2, Inner1, Bottom Layer. Coordinates in mm from the lower left corner of the outline.
Outline path: 0,50.17 27.56,50.17 27.58,50.15 27.58,43.83 45.19,43.83 45.19,50.04 60.07,50.04 60.07,0 0,0 0,50.17
Stack: Top Layer 0.035mm Outer layer thickness 1oz / Dielectric1 0.2104mm 7628 RC49% 8.6mil / Dielectric2 1.065mm 1.1mm H/HOZ Copper / Inner2 0.0152mm Inner layer thickness / Dielectric3 0.2104mm 7628 RC49% 8.6mil / Bottom Layer 0.035mm Outer layer thickness 1oz

## Design rules (mm)
net USB-DM: DP1
net USB-DP: DP1
spacing copperThickness1oz (default): track to track 0.102, other pairs 0.152 to 0.3
spacing copperThickness2oz: track to track 0.203, other pairs 0.152 to 0.3
track width copperThickness1oz (default): min 0.127, default 0.254, max 2.54
track width copperThickness2oz: min 0.203, default 0.254, max 2.54
differential pair differentialPair (default): width min 0.127, default 0.152, max 2.54; gap min 0.203, default 0.203
net GND uses copperRegion

## Placement (name value [footprint] x y rotation side)
C1  220pF  [C0603]  50.38 8.52 270 top
C2  220pF  [C0603]  49.94 21.8 270 top
C3  220pF  [C0603]  50.32 15.45 270 top
C4  10uF  [C0603]  42.83 19.01 0 top
C5  10uF  [C0603]  43.29 11.28 0 top
C6  10uF  [C0603]  42.7 23.71 0 top
C7  100nF  [C0603]  42.68 25.41 180 top
C8  100nF  [C0603]  43.31 12.93 180 top
C9  100nF  [C0603]  42.83 17.48 180 top
C10  22pF  [C0603]  22.1 27.05 90 top
C11  22pF  [C0603]  27.56 26.29 90 top
C12  100nF  [C0603]  11.05 22.23 90 top
C13  1uF  [C0402]  9.91 31.24 180 top
C14  10uF  [C0603]  4.06 35.18 180 top
C15  100nF  [C0603]  4.06 33.91 180 top
C16  100nF  [C0603]  38.1 17.02 180 top
C17  100nF  [C0603]  11.05 11.56 90 top
C18  100nF  [C0603]  11.43 26.42 180 top
C19  100nF  [C0603]  11.43 24.77 180 top
C20  100nF  [C0603]  50.04 43.43 180 top
C21  22uF  [C0603]  50.04 35.94 180 top
C22  1uF  [C0603]  16.64 14.1 0 top
C23  1uF  [C0603]  16.64 12.45 0 top
C24  10uF  [C0603]  34.16 19.3 180 top
C25  100nF  [C0603]  16.64 18.92 0 top
C26  100nF  [C0603]  16.64 20.57 0 top
C27  100nF  [C0603]  29.21 10.67 90 top
C28  10uF  [C0603]  14.22 15.62 270 top
C29  10uF  [C0603]  27.56 10.67 90 top
C30  100nF  [C0603]  29.08 26.29 270 top
C31  100nF  [C0603]  24.89 43.56 0 top
C32  100nF  [C0603]  22.48 10.67 90 top
C33  100nF  [C0603]  16.64 22.23 0 top
C34  100nF  [C0603]  16.64 17.27 0 top
C35  100nF  [C0603]  34.16 15.37 180 top
C36  10uF  [C0603]  16.64 15.62 0 top
C37  1uF  [C0603]  34.16 13.72 180 top
C38  10uF  [C0603]  14.22 18.67 270 top
C40  100nF  [C0603]  16 32.89 90 top
H1  HX PZ2.54-2x10P ZZ  [HDR-TH_20P-P2.54-V-M-R2-C10-S2.54]  24.38 4.32 0 top
H2  LAIL-PZ2.54-2P-L  [CONN-TH_LAIL-PZ2.54-2P-L]  58.42 21.72 90 top
L1  1.5uH  [L0805]  42.68 21.81 180 top
L2  1.5uH  [L0805]  42.81 15.71 180 top
L3  1.5uH  [L0805]  43.31 9.4 180 top
LED1  GL0805UR01  [LED0805-R-RD_RED]  33.15 26.29 270 top
LED2  GL0805UR01  [LED0805-R-RD_RED]  31.12 26.29 270 top
R1  100kΩ  [R0805]  51.59 11.13 180 top
R2  100kΩ  [R0805]  51.46 17.74 0 top
R3  82.5kΩ  [R0805]  47.53 8.59 180 top
R4  330kΩ  [R0805]  47.53 14.94 180 top
R5  430kΩ  [R0805]  52.73 22.18 180 top
R6  22kΩ  [R0805]  51.08 26.25 0 top
R7  100kΩ  [R0805]  51.08 24.21 0 top
R8  3KΩ  [R0805]  11.05 18.8 90 top
R9  100kΩ  [R0805]  3.94 30.23 0 top
R10  NC-0Ω  [R0805]  10.03 33.91 90 top
R11  6.8kΩ  [R0805]  3.94 32.13 0 top
R12  2kΩ  [R0805]  34.54 17.4 0 top
R13  2kΩ  [R0805]  36.96 14.22 90 top
R14  3KΩ  [R0805]  11.56 28.32 0 top
R15  10kΩ  [R0805]  24.89 35.69 270 top
R16  3KΩ  [R0805]  11.18 14.99 90 top
R17  10kΩ  [R0805]  21.59 40.51 180 top
R18  10kΩ  [R0805]  19.18 32.26 0 top
R19  5.1kΩ  [R0805]  49.66 37.72 0 top
R20  5.1kΩ  [R0805]  49.53 41.53 0 top
R21  3KΩ  [R0805]  14.7 27.44 270 top
SW1  TS-KG89S-AT25F  [SW-SMD_4P-L4.2-W3.3-P2.15-LS5.1]  5.97 15.75 180 top
SW2  TS-KG89S-AT25F  [SW-SMD_4P-L4.2-W3.3-P2.15-LS5.1]  5.97 11.3 180 top
SW3  TS-KG89S-AT25F  [SW-SMD_4P-L4.2-W3.3-P2.15-LS5.1]  5.97 24.51 180 top
SW4  TS-KG89S-AT25F  [SW-SMD_4P-L4.2-W3.3-P2.15-LS5.1]  5.97 20.19 180 top
U1  F1C200S  [QFN-88_L10.0-W10.0-P0.40-BL-EP6.75]  25.01 18.38 0 top
U2  SY8089A1AAC  [TSOT-23-5_L2.9-W1.6-P0.95-LS2.8-BR]  47.53 11.51 180 top
U3  SY8089A1AAC  [TSOT-23-5_L2.9-W1.6-P0.95-LS2.8-BR]  47.27 17.74 180 top
U4  SY8089A1AAC  [TSOT-23-5_L2.9-W1.6-P0.95-LS2.8-BR]  47.02 23.96 180 top
U5  SY6280AAC  [SOT-23-5_L3.0-W1.7-P0.95-LS2.8-BL]  7.24 33.27 180 top
U6  2.4GHz  [BULETM-SMD_ESPRESSIF_ESP32-C3-WROOM-02-N4-4MB]  36.45 36.7 0 top
U7  W25N01GVZEIG  [WSON-8_L8.0-W6.10-P1.27-TL-EP]  18.8 36.7 180 top
USB1  906-162A1011D10200  [USB-A-TH_4P-P1.40-V-F-C39416]  8.76 41.15 180 top
USB3  TYPE-C 16PIN 2MD(073)  [USB-C-SMD_TYPE-C-16PIN-2MD-073]  55.12 39.24 90 top
X1  24MHz  [CRYSTAL-SMD_4P-L3.2-W2.5-BL]  24.77 27.05 90 top

## Footprints (pads in the part's own frame, mm; a bottom-side part is the same pattern mirrored in y, then rotated)
BULETM-SMD_ESPRESSIF_ESP32-C3-WROOM-02-N4-4MB
  rect 2x1 hole 0.001: 1(-8.75,6) 2(-8.75,4.5) 3(-8.75,3) 4(-8.75,1.5) 5(-8.75,0) 6(-8.75,-1.5) 7(-8.75,-3) 8(-8.75,-4.5) 9(-8.75,-6) 10(8.75,-6) 11(8.75,-4.5) 12(8.75,-3) 13(8.75,-1.5) 14(8.75,0) 15(8.75,1.5) 16(8.75,3) 17(8.75,4.5) 18(8.75,6)
  rect 0.7x0.7 hole 0.001: 19(-0.14,0.9) 19(-0.14,-0.2) 19(-0.14,-1.3) 19(0.96,0.9) 19(0.96,-0.2) 19(0.96,-1.3) 19(2.06,0.9) 19(2.06,-0.2) 19(2.06,-1.3)
C0402
  rect 0.5x0.54 hole 0.001: 1(-0.42,0) 2(0.42,0)
C0603
  rect 0.8x0.9 hole 0.001: 1(-0.7,0) 2(0.7,0)
CONN-TH_LAIL-PZ2.54-2P-L
  rect 1.6x1.6 hole 1: 1(-1.27,0)
  round 1.6 hole 1: 2(1.27,0)
CRYSTAL-SMD_4P-L3.2-W2.5-BL
  rect 1.4x1.2 hole 0.001: 1(-1.1,-0.85) 2(1.1,-0.85) 3(1.1,0.85) 4(-1.1,0.85)
HDR-TH_20P-P2.54-V-M-R2-C10-S2.54
  rect 1.7x1.7 hole 1.1: 1(-11.43,-1.27)
  round 1.7 hole 1.1: 2(-11.43,1.27) 3(-8.89,-1.27) 4(-8.89,1.27) 5(-6.35,-1.27) 6(-6.35,1.27) 7(-3.81,-1.27) 8(-3.81,1.27) 9(-1.27,-1.27) 10(-1.27,1.27) 11(1.27,-1.27) 12(1.27,1.27) 13(3.81,-1.27) 14(3.81,1.27) 15(6.35,-1.27) 16(6.35,1.27) 17(8.89,-1.27) 18(8.89,1.27) 19(11.43,-1.27) 20(11.43,1.27)
L0805
  rect 1.133x1.377 hole 0.001: 1(-0.966,0) 2(0.966,0)
LED0805-R-RD_RED
  rect 1x1.399 hole 0.001: 1(1.05,0) 2(-1.05,0)
QFN-88_L10.0-W10.0-P0.40-BL-EP6.75
  rect 0.2x0.8 hole 0.001: 1(-4.2,-5) 2(-3.8,-5) 3(-3.4,-5) 4(-3,-5) 5(-2.6,-5) 6(-2.2,-5) 7(-1.8,-5) 8(-1.4,-5) 9(-1,-5) 10(-0.6,-5) 11(-0.2,-5) 12(0.2,-5) 13(0.6,-5) 14(1,-5) 15(1.4,-5) 16(1.8,-5) 17(2.2,-5) 18(2.6,-5) 19(3,-5) 20(3.4,-5) 21(3.8,-5) 22(4.2,-5) 45(4.2,5) 46(3.8,5) 47(3.4,5) 48(3,5) 49(2.6,5) 50(2.2,5) 51(1.8,5) 52(1.4,5) 53(1,5) 54(0.6,5) 55(0.2,5) 56(-0.2,5) 57(-0.6,5) 58(-1,5) 59(-1.4,5) 60(-1.8,5) 61(-2.2,5) 62(-2.6,5) 63(-3,5) 64(-3.4,5) 65(-3.8,5) 66(-4.2,5)
  rect 0.8x0.2 hole 0.001: 23(5,-4.2) 24(5,-3.8) 25(5,-3.4) 26(5,-3) 27(5,-2.6) 28(5,-2.2) 29(5,-1.8) 30(5,-1.4) 31(5,-1) 32(5,-0.6) 33(5,-0.2) 34(5,0.2) 35(5,0.6) 36(5,1) 37(5,1.4) 38(5,1.8) 39(5,2.2) 40(5,2.6) 41(5,3) 42(5,3.4) 43(5,3.8) 44(5,4.2) 67(-5,4.2) 68(-5,3.8) 69(-5,3.4) 70(-5,3) 71(-5,2.6) 72(-5,2.2) 73(-5,1.8) 74(-5,1.4) 75(-5,1) 76(-5,0.6) 77(-5,0.2) 78(-5,-0.2) 79(-5,-0.6) 80(-5,-1) 81(-5,-1.4) 82(-5,-1.8) 83(-5,-2.2) 84(-5,-2.6) 85(-5,-3) 86(-5,-3.4) 87(-5,-3.8) 88(-5,-4.2)
  rect 6.75x6.75 hole 0.001: 89(0,0)
R0805
  rect 1.133x1.377 hole 0.001: 1(-1,0) 2(1,0)
SOT-23-5_L3.0-W1.7-P0.95-LS2.8-BL
  rect 0.49x1.157 hole 0.001: 1(-0.95,-1.153) 2(0,-1.153) 3(0.95,-1.153)
  rect 0.49x1.175 hole 0.001: 4(0.95,1.153) 5(-0.95,1.153)
SW-SMD_4P-L4.2-W3.3-P2.15-LS5.1
  rect 1.3x0.7 hole 0.001: 1(-2.25,1.075) 2(2.25,1.075) 3(-2.25,-1.075) 4(2.25,-1.075)
TSOT-23-5_L2.9-W1.6-P0.95-LS2.8-BR
  rect 1.1x0.7 hole 0.001: 1(1.294,-0.951) 2(1.294,-0.001) 3(1.294,0.951) 4(-1.294,0.951) 5(-1.294,-0.949)
USB-A-TH_4P-P1.40-V-F-C39416
  round 1.2 hole 0.8: 1(2.098,3.8) 2(0.699,3.8) 3(-0.699,3.8) 4(-2.098,3.8)
  oval 2.1x2.7 hole 1.6x2.1: 5(-3.081,1.801)
  oval 2.1x2.7 hole 1.6x2.3: 6(3.081,1.801)
  oval 3x1.8 hole 2.4x1.2: 7(-0.01,-3.8)
USB-C-SMD_TYPE-C-16PIN-2MD-073
  oval 1.1x2 hole 0.6x1.5: 13(-4.325,1.825) 14(4.325,1.825)
  oval 1.2x1.8 hole 0.6x1.2: 13(-4.325,-2.375) 14(4.325,-2.375)
  rect 0.55x1.1 hole 0.001: A1B12(-3.2,2.375) A4B9(-2.4,2.375) B1A12(3.2,2.375) B4A9(2.4,2.375)
  rect 0.3x1.1 hole 0.001: A5(-1.25,2.375) A6(-0.25,2.375) A7(0.25,2.375) A8(1.25,2.375) B5(1.75,2.375) B6(0.75,2.375) B7(-0.75,2.375) B8(-1.75,2.375)
WSON-8_L8.0-W6.10-P1.27-TL-EP
  oval 1.115x0.581 hole 0.001: 1(-4.033,1.905) 2(-4.033,0.635) 3(-4.033,-0.635) 4(-4.033,-1.905) 5(4.033,-1.905) 6(4.033,-0.635) 7(4.033,0.635) 8(4.033,1.905)
  rect 3.4x4.3 hole 0.001: 9(0,0)

## Nets
As in the schematic.

Pads without a net: SW1 2 3; SW2 2 3; SW3 2 3; SW4 2 3; U1 1 2 3 6 7 8 14 15 16 17 18 23 24 26 27 28 29 45 47 53 54 55 56 57 58 63 64 65 66 72 77 78 79 84 85 86 87 88; U6 4 13 14 17 18; USB3 A6 A7 A8 B6 B7 B8

## Via types
v1: diameter 0.61, hole 0.305, Top Layer to Bottom Layer, 127 vias

## Routing (per net, layer and track width the routed paths; a pad name or vN(x,y) marks a point on that pad's centre or on a via; arc(x,y) is an arc through that point)
1.1V: length 67.5
  Top Layer w0.254: C25.2 17.4,18.98 v1(17.4,19.84) 17.4,20.51 C26.2 17.34,20.64 17.65,20.95 19.99,20.95 20.01,20.98 ; 30.01,18.98 33.13,18.98 C24.2 ; v1(29.21,11.68) 29.21,13.37 U1.22
  Top Layer w0.381: C24.2 33.46,19.49 34.07,20.1 35.41,20.1 37.47,18.03 39.21,18.03 39.62,17.62 39.62,13.08 v1(39.5,12.95)
  Top Layer w0.508: C8.2 42.61,11.3 C5.1 42.59,9.58 42.37,9.36 43.98,7.75 45.68,7.75 R3.2 46.53,8 47.16,7.37 49.93,7.37 C1.2
  Top Layer w0.635: C8.2 v1(40.87,12.93)
  Inner2 w1.016: v1(40,11.3) 19.69,11.3 17.4,13.59 v1(17.4,18.18) v1(17.4,19.84)
  vias: v1(41.28,12.19)
2V5: length 43
  Top Layer w0.254: v1(33.01,15.37) C35.2 ; v1(33.01,15.37) 33.01,13.96 v1(32.77,13.72) C37.2 ; v1(33.01,15.37) 31.41,16.98 30.01,16.98 U1.31 ; R4.2 46.53,14.56 47.24,13.84 49.41,13.84 C3.2 ; 29.39,18.58 29.08,18.27 29.08,17.83 29.26,17.65 29.84,17.65 v1(29.97,17.53) ; 29.39,18.58 29.21,18.76 29.21,19.18 29.41,19.38 U1.36 ; 29.39,18.58 30.01,18.58 ; U1.80 19.03,17.38 v1(18.67,17.02) 18.67,16.51 17.78,15.62 C36.2
  Top Layer w0.508: R4.2 45.81,14.22 42.67,14.22 41.86,15.04 41.86,15.58 42.13,15.84 C9.2 C4.1
  Top Layer w0.635: C4.1 41.7,19.43 39.62,19.43
  Inner2 w1.016: v1(29.97,17.53) 29.46,17.02 18.8,17.02
  vias: v1(35.62,17.18) v1(39.12,19.69) v1(40.39,19.79) v1(40.39,18.8)
3V3: length 61.9
  Top Layer w0.203: v1(24.89,37.72) R15.1
  Top Layer w0.254: R8.1 11.19,17.8 v1(13.97,20.57) ; 20.01,22.58 19.73,22.86 v1(19.56,22.86) ; v1(21.46,10.16) 21.46,10.35 C32.2 22.44,11.41 22.44,13.35 U1.5 U1.4 ; R21.1 14.7,28.86 v1(13.97,29.59) 11.05,29.59 10.56,29.1 R14.1 ; U7.8 15.11,34.45 v1(15.11,33.78) 15.3,33.59 C40.2 ; v1(26.54,10.29) 26.54,10.35 C29.2 27.56,11.56 28.41,12.41 U1.20 ; R18.2 20.55,32.63 v1(20.55,33.23) ; R16.1 11.83,13.34 v1(14.1,13.34) ; v1(25.64,41.28) 25.64,43.51 ; C2.2 50.65,21.1 R5.2 ; v1(17.72,22.23) C33.2 ; U1.73 19.99,20.15 18.63,20.15 18.16,19.69 18.16,18.1 C34.2 16.57,18.03 15.62,18.03 15.51,18.14 v1(15.22,18.14) ; U1.50 27.21,24.38 27.39,24.56 28.06,24.56 C30.2 29.65,25.59 v1(29.72,25.65)
  Top Layer w0.508: C2.2 49.16,20.32 43.09,20.32 41.73,21.67 42,21.94 C6.1 42,25.39
  Top Layer w0.635: U6.1 26.45,42.7 C31.2 ; 40.13,26.67 40.72,26.67 41.98,25.41
  Bottom Layer w0.254: v1(19.56,22.86) 18.92,22.23 v1(17.72,22.23)
  vias: v1(23.11,40.51) v1(38.6,25.4) v1(38.99,26.8) v1(40,25.91) v1(40.64,25.4) v1(40.89,27.05)
+5V: length 185.8
  Top Layer w0.254: C20.1 51.05,43.43 51.56,42.93 51.56,42.4 52.32,41.64 53.2,41.64 53.49,41.36 54.16,41.36 54.36,41.16 54.36,38 53.2,36.84 USB3.A4B9
  Top Layer w0.381: U3.4 46.66,18.69 U3.1 ; U2.4 46.92,12.47 46.23,12.47 ; C21.1 51.33,35.94 52.23,36.84 USB3.A4B9 ; R10.1 9.24,32.12 8.61,32.12 ; 8.61,32.12 U5.5 ; 8.61,32.12 C13.2 ; U4.1 46.41,24.91 U4.4
  Top Layer w0.508: 46.23,12.47 46.99,13.22 56.65,13.22 58.42,14.99 H2.1 57.53,19.56 46.85,19.56 U3.1
  Top Layer w0.635: H1.19 52.45,3.05 56.65,7.25 56.65,13.22 ; U4.1 49.64,28.83 50.61,28.83
  Top Layer w0.762: v1(11.3,32.13) 10.53,32.91 R10.1 ; C21.1 50.74,28.96 50.61,28.83 54.1,28.83 56.39,26.54 56.39,22.48 H2.1
  Inner2 w0.762: v1(11.3,32.13) 12.83,32.13 14.1,33.4 14.1,37.08 14.96,37.94 14.96,42.26 15.49,42.8 44.45,42.8 47.75,39.5 47.75,31.12 H2.1
GND: length 72.7
  Top Layer w0.203: v1(44.52,23.71) 45.47,23.71 U4.2 ; C25.1 15.71,18.7 14.99,18.7 14.71,18.42 14.19,18.42 ; U1.74 23.61,19.78 v1(25.01,18.38) ; v1(35.69,14.48) 34.86,15.3 C35.1 ; v1(35.69,14.48) 36.94,13.22 R13.1 v1(36.96,12.27) ; v1(35.69,14.48) 34.93,13.72 C37.1 ; v1(12.06,21.21) 11.37,21.21 C12.1 ; C34.1 15.89,17.32 14.02,17.32 13.59,16.9 v1(12.95,16.9) ; C4.2 43.61,18.92 v1(44.7,18.92) ; v1(45.09,12.95) 44.03,12.95 C8.1 ; v1(14.73,12.45) C23.1 C22.1 C36.1 v1(13.39,15.62) ; v1(12.95,18.42) 14.19,18.42 ; 14.19,18.42 14.22,18.38 14.22,17.97 ; v1(44.7,17.02) 43.99,17.02 C9.1 ; R20.1 48.64,41.42 v1(48.64,39.5) 48.64,37.73 R19.1 ; C7.1 44.08,25.41 v1(44.52,25.85) ; U2.2 45.88,11.86 45.58,11.86 45.37,12.06 v1(45.09,12.06) ; v1(45.09,11.14) 44.14,11.14 C5.2 ; U3.2 45.68,18.03 v1(44.7,18.03) ; C32.1 21.91,9.4 v1(20.83,9.4) ; C6.2 44.52,24.82 v1(44.52,24.84)
  Top Layer w0.254: v1(37.41,36.5) U6.19 ; v1(37.41,36.5) U6.19 ; v1(37.41,36.5) U6.19 ; v1(37.41,36.5) U6.19 ; C24.1 35.31,18.86 v1(35.31,18.67) ; C10.2 v1(22.1,28.7) 22.61,28.7 v1(23.37,29.46) v1(24.74,29.46) v1(26.03,29.46) 26.8,28.7 v1(26.8,28.45) ; C31.1 23.94,43.81 v1(23.37,43.81) ; C30.1 28.96,27.12 v1(28.96,27.94) ; v1(26.8,28.45) 27.05,28.45 v1(27.56,27.94) 27.56,27.81 v1(26.67,26.92) ; v1(26.8,28.45) 26.5,28.15 X1.2 ; USB3.A1B12 52.74,35.47 USB3.13 ; 52.74,42.44 52.74,43.02 USB3.14 ; LED1.2 33.15,28.16 v1(33.13,28.18) ; LED2.2 31.12,28.18 ; v1(25.01,18.38) 23.21,16.58 20.01,16.58
  Top Layer w0.635: v1(14.82,22.23) C33.1 ; v1(14.99,20.57) C26.1
  vias: v1(13.21,24.38) v1(22.73,20.83) v1(22.75,18.38) v1(22.73,15.75) v1(23.88,25.42) v1(25.01,20.83) v1(25.15,15.75) v1(27.31,9.53) v1(27.56,20.83) v1(27.56,18.42) v1(27.56,15.75) v1(29.72,9.65) v1(31.11,28.18) v1(34.54,15.37) v1(36.31,37.6) v1(36.31,35.4) v1(38.51,37.6) v1(38.51,35.4) v1(38.74,16) v1(52.45,20.57) v1(52.66,9.2) v1(52.82,24.21) v1(53.16,17.74) v1(53.34,11.13) v1(53.72,7.11) v1(53.85,15.88) v1(54.74,10.92) v1(54.99,16.89) v1(55.75,20.95)
ESP_UART_RX: length 42.5
  Top Layer w0.152: U6.11 44.49,31.5 v1(43.61,31.5)
  Bottom Layer w0.152: v1(43.61,31.5) 43.61,24.69 41.4,22.48 38.48,22.48 36.89,20.89 36.89,13.4 31.5,8 23.75,8 23.11,7.37 H1.10
ESP_UART_TX: length 45.7
  Top Layer w0.152: v1(43.81,33.66) 45.15,33.66 U6.12
  Bottom Layer w0.152: H1.8 20.57,6.1 22.86,8.38 31.12,8.38 36.32,13.59 36.32,21.34 38.1,23.11 41.15,23.11 43.05,25.02 43.05,32.89 v1(43.81,33.66)
F4BOOT: length 14
  Top Layer w0.152: U1.12 25.21,10.12 v1(25.35,9.98) ; v1(28.83,8.94) 29.46,8.31 29.46,4.32 H1.15
  Bottom Layer w0.152: v1(25.35,9.98) 26.39,8.94 v1(28.83,8.94)
F4RESET: length 12.1
  Top Layer w0.152: H1.7 21.72,4.19 21.72,5.97 24.81,9.07 U1.11
FB1: length 6.4
  Top Layer w0.254: R3.1 49.75,8.59 C1.1 50.59,9.43 R1.2 49.26,12.46 U2.5
FB2: length 6.2
  Top Layer w0.254: R4.1 49.11,14.94 50.46,16.29 R2.1 49.51,17.74 U3.5
FB3: length 6.2
  Top Layer w0.254: C2.1 50.08,22.64 R7.1 49.01,24.21 U4.5 49.65,26.25 R6.1
HOSCI: length 4.6
  Top Layer w0.152: U1.51 26.81,24.53 27.56,25.27 C11.1 25.98,25.59 X1.1
HOSCO: length 8.8
  Top Layer w0.152: U1.52 26.41,24.26 25.78,24.89 23.34,24.89 22.86,25.37 22.86,25.59 C10.1 23.9,28.15 X1.3
KEY_USER: length 27.3
  Top Layer w0.152: v1(15.62,26.42) 14.72,26.42 R21.2 ; v1(28.83,24.26) 28.83,23.39 U1.46
  Top Layer w0.254: R21.2 13.97,25.71 12.66,25.71 12.65,25.69 11.65,25.69 C19.2 10.73,24.45 9.4,23.11 9.4,20.3 SW4.1
  Bottom Layer w0.152: v1(28.83,24.26) 17.78,24.26 v1(15.62,26.42)
LED_ERR: length 3.1
  Top Layer w0.203: LED2.1 31.12,23.68 30.01,22.58
LED_RUN: length 5.1
  Top Layer w0.203: U1.43 31.32,22.18 33.15,24 LED1.1
LINUX_UART_RX: length 25
  Top Layer w0.152: v1(27.43,22.48) 27.61,22.66 U1.49
  Bottom Layer w0.152: H1.2 12.95,5.72 15.75,8.51 17.65,8.51 23.88,14.73 23.88,18.92 v1(27.43,22.48)
LINUX_UART_TX: length 24.2
  Top Layer w0.152: v1(28.19,22.35) 28.19,22.77 28.01,22.95 U1.48
  Bottom Layer w0.152: H1.4 15.49,7.49 16.13,8.13 18.03,8.13 24.38,14.48 24.38,18.54 v1(28.19,22.35)
LX1: length 2.4
  Top Layer w0.508: U2.3 45.02,9.36 44.3,9.36
LX2: length 2.7
  Top Layer w0.508: U3.3 44.77,15.58 43.79,15.58
LX3: length 2.6
  Top Layer w0.508: 43.67,21.67 44.39,21.67 U4.3
RESET: length 20.4
  Top Layer w0.203: U1.70 13.17,21.38 11.62,22.92 C12.2 10.35,22.92 9.93,22.5 9.93,20.92 R8.2 9.4,18.14 9.4,15.85 SW1.1
SPI0_CS: length 14.9
  Top Layer w0.152: U1.60 23.14,23.45 23.14,23.87 22.5,24.51 21.84,24.51 19.3,27.05 19.3,29.08 22.83,32.61 U7.1
SPI0_MISO: length 16.3
  Top Layer w0.152: U1.61 22.81,23.8 22.35,24.26 21.72,24.26 18.95,27.03 18.95,29.23 21.95,32.24 21.95,35.19 U7.2
SPI0_MOSI: length 19.7
  Top Layer w0.152: U7.5 13.72,37.56 13.72,33.27 18.16,28.83 18.16,27.31 21.46,24 22.25,24 22.41,23.84 U1.62
SPI0_SCK: length 18
  Top Layer w0.152: U1.59 23.61,23.8 22.65,24.77 22.1,24.77 20.57,26.29 v1(20.57,27.81) ; v1(15.75,36.32) 14.76,37.31 U7.6
  Bottom Layer w0.152: v1(20.57,27.81) 20.54,27.85 20.54,28.75 15.75,33.55 v1(15.75,36.32)
SVREF: length 9.7
  Top Layer w0.203: 36.83,16.26 37.4,16.83 C16.2 ; 36.83,16.26 36.83,15.35 R13.2 ; 36.83,16.26 34.69,16.26 R12.1 32.77,18.18 U1.33
TV_VRN: length 5.6
  Top Layer w0.254: U1.75 v1(18.8,19.38)
  Bottom Layer w0.254: v1(14.6,19.38) 14.73,19.25 18.8,19.25 v1(18.8,19.38)
TV_VRP: length 7
  Top Layer w0.254: v1(14.48,16.76) 14.48,16.58 C28.1 ; v1(18.8,18.54) 19.09,18.54 19.5,18.95 19.99,18.95 20.01,18.98
  Bottom Layer w0.254: v1(14.48,16.76) 17.02,16.76 v1(18.8,18.54)
UART1_RX: length 18.6
  Top Layer w0.152: U1.9 24.01,10.33 22.19,8.51 17.91,8.51 16.64,7.24 16.64,4.7 16.26,4.32 14.35,4.32 13.08,3.05 H1.1
UART1_TX: length 16.4
  Top Layer w0.152: U1.10 24.41,10.06 22.48,8.13 20.13,8.13 19.37,7.37 19.37,5.27 18.29,4.19 17.15,4.19 16,3.05 H1.3
UART2_RX: length 11.6
  Top Layer w0.152: U1.21 28.81,13.37 28.81,12.14 28.36,11.69 28.36,9.44 26.8,7.87 26.8,4.19 H1.11
UART2_TX: length 12.6
  Top Layer w0.152: H1.9 24.51,4.45 24.51,7.49 25.91,8.89 25.91,11.05 27.05,12.19 27.43,12.19 28.01,12.77 U1.19
USB-5V: length 11
  Top Layer w0.381: 4.76,33.91 4.76,35.18 4.95,35.37 4.95,35.82 ; 4.95,35.82 7.8,35.82 8.19,35.43 U5.1 9.55,34.43 R10.2 ; 4.95,35.82 4.95,36.2 6.11,37.35 USB1.1
USB-DM: length 21.7
  Top Layer w0.152: U1.68 19.27,22.18 18.92,22.52 18.92,23.39 17.27,25.04 17.27,28.7 12.17,33.81 v1(12.17,35.18)
  Bottom Layer w0.152: USB1.2 8.11,37.35 9.93,35.53 11.81,35.53 v1(12.17,35.18)
USB-DP: length 21.7
  Top Layer w0.152: v1(11.63,36.06) 11.58,36.01 11.58,34.82 arc(11.6,34.76) 11.66,34.74 arc(11.71,34.72) 11.73,34.67 11.73,34.31 arc(11.71,34.26) 11.66,34.23 arc(11.6,34.21) 11.58,34.16 11.58,33.89 16.92,28.55 16.92,24.89 18.57,23.24 18.57,22.37 19.12,21.82 19.97,21.82 U1.69
  Bottom Layer w0.152: USB1.3 9.46,36.5 9.9,36.06 v1(11.63,36.06)
USB-EN: length 45.2
  Top Layer w0.152: R9.2 5.45,29.72 v1(5.84,29.72) ; 25.71,12.46 25.71,12.51 25.61,12.61 U1.13
  Top Layer w0.254: U5.4 6.28,32.11 6.28,30.79 6.1,30.61 5.32,30.61 R9.2
  Bottom Layer w0.152: v1(5.84,29.72) 8.64,29.72 11.05,27.31 16.38,27.31 17.65,26.03 28.57,26.03 30.1,24.51 30.1,21.97 25.75,17.62 v1(25.75,12.52)
VRA1: length 4.3
  Top Layer w0.203: C22.2 17.34,14.41 19.05,16.13 19.05,16.47 19.56,16.98 20.01,16.98
VRA2: length 5.1
  Top Layer w0.203: U1.83 19.56,16.18 18.8,15.42 18.8,13.97 17.34,12.51 C23.2
WIFI-BOOT: length 23.8
  Top Layer w0.203: U6.8 26.95,31.46 25.56,31.46 24.33,30.23 21.36,30.23 v1(19.84,28.7) ; R14.2 12.94,28.7 v1(13.46,28.7)
  Top Layer w0.254: SW3.1 8.83,23.44 9.4,24 9.4,25.08 C18.2 10.73,26.49 R14.2
  Bottom Layer w0.203: v1(19.84,28.7) v1(13.46,28.7)
WIFI-RESET: length 61.9
  Top Layer w0.152: R16.2 11.95,15.99 v1(12.32,15.62) ; v1(31.12,14.98) 30.01,14.98 29.94,14.9 29.52,14.9 29.22,14.61 29.21,14.61 28.96,14.35 v1(21.21,14.35) ; v1(29.46,41.15) 27.75,41.15 U6.2
  Top Layer w0.203: C17.2 10.87,12.08 9.38,12.08 ; R16.2 9.38,14.19 9.38,12.08 ; SW2.1 9.38,11.39 9.38,12.08
  Bottom Layer w0.152: v1(12.32,15.62) 13.59,14.35 v1(21.21,14.35) ; v1(29.46,41.15) 30.99,41.15 34.42,37.72 34.42,18.28 v1(31.12,14.98)
WIFI_DATA: length 29.7
  Top Layer w0.152: U1.37 32.73,19.78 37.74,24.79 37.74,31.09 29.13,39.7 U6.3
WIFI_HANDSHAKE: length 26.4
  Top Layer w0.152: U6.15 44.97,37.97 43.94,37.97 v1(43.69,37.72) ; v1(37.21,30.61) 37.21,24.77 32.62,20.18 U1.38
  Bottom Layer w0.152: v1(43.69,37.72) 37.21,31.24 v1(37.21,30.61)
WIFI_SPI_CS: length 21.8
  Top Layer w0.152: v1(35.13,29.84) 35.13,24.84 32.06,21.78 U1.42 ; U6.10 42.64,30.7 v1(42.42,30.48)
  Bottom Layer w0.152: v1(42.42,30.48) 41.78,29.84 v1(35.13,29.84)
WIFI_SPI_MISO: length 27.6
  Top Layer w0.152: v1(36.58,31.24) 36.58,24.64 32.51,20.58 30.01,20.58 ; U6.16 44.02,39.7 v1(43.05,38.73)
  Bottom Layer w0.152: v1(36.58,31.24) 43.05,37.72 v1(43.05,38.73)
WIFI_SPI_MOSI: length 23
  Top Layer w0.152: U6.6 31.34,35.2 35.69,30.86 35.69,24.77 32.3,21.38 U1.41
WIFI_SPI_SCK: length 24.8
  Top Layer w0.152: 30.01,20.98 32.41,20.98 36.04,24.61 36.04,31.27 30.73,36.58 27.83,36.58 U6.5
$1N25: length 5
  Top Layer w0.254: R5.1 53.73,25.01 52.49,26.25 R6.2
$1N102: length 2.9
  Top Layer w0.254: U5.3 6.29,33.48 R11.2
$1N125: length 3.2
  Top Layer w0.203: R15.2 25.13,34.45 26.95,34.45 U6.7
$1N137: length 4.1
  Top Layer w0.152: U7.3 20.59,39.58 R17.2
$1N141: length 5.2
  Top Layer w0.152: R18.1 17.65,32.78 17.65,33.18 U7.7
$1N180: length 2.4
  Top Layer w0.203: USB3.B5 51.07,40.99 R20.2
$1N181: length 2.2
  Top Layer w0.203: R19.2 50.93,37.99 USB3.A5

## Copper pours and planes (outline as drawn; the poured copper is in the pictures)
1.1V on Top Layer: 38.74,13.59 41.9,13.59 41.9,10.88 38.74,10.88
1.1V on Inner2: 38.74,13.59 41.9,13.59 41.9,10.88 38.74,10.88
2V5 on Top Layer: 38.35,20.57 41.02,20.57 41.02,18.42 38.35,18.42
2V5 on Inner2: 41.02,20.32 41.02,16.26 37.77,13.01 32.84,13.01 32.63,12.98 29.31,12.98 29.31,18.37 38.49,18.28 38.42,20.32
3V3 on Top Layer: 38.1,27.56 41.38,27.56 41.38,24.79 38.1,24.79
3V3 on Inner2: 13.72,41.66 42.39,41.66 42.39,1.55 13.72,1.55
GND on Top Layer: -5.97,51.94 68.58,51.94 68.58,-3.43 -5.97,-3.43
GND on Bottom Layer: -8.38,53.59 69.98,53.59 69.98,-3.43 -8.38,-3.43
GND on Inner2: -3.17,54.1 62.1,54.1 62.1,-1.27 -3.17,-1.27
